# Altium project Ezlo_Voice_AssistantHUB.PrjPcb (part 3 of 10)

## Sheet Power_Sheet_1.SchDoc
size A4; DocumentNumber: 3; SheetNumber: 3; SheetTotal: 27
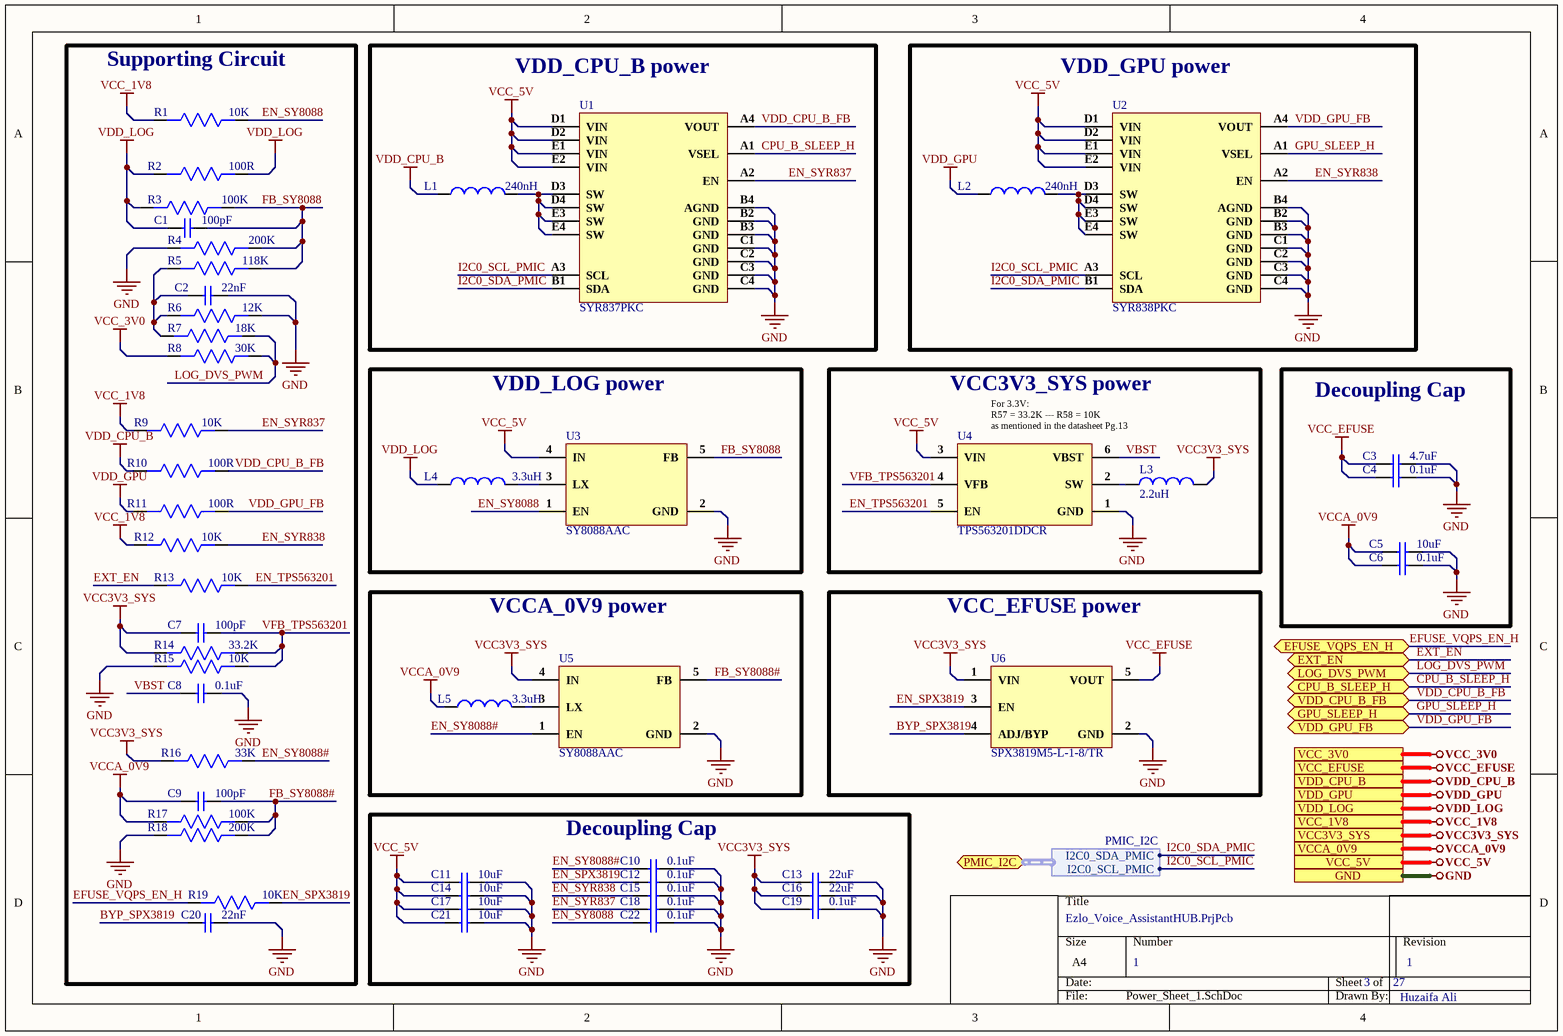
[diagram p5: Power_Sheet_1.SchDoc]

### Parts
C1  100pF  [Cap0603]
C2  22nF  [Cap0603]
C3  4.7uF  [Cap0603]
C4  0.1uF  [Cap0402]
C5  10uF  [Cap0603]
C6  0.1uF  [Cap0402]
C7  100pF  [Cap0603]
C8  0.1uF  [Cap 0402]
C9  100pF  [Cap0603]
C10  0.1uF  [Cap0402]
C11  10uF  [Cap0603]
C12  0.1uF  [Cap0402]
C13  22uF  [Cap0805]
C14  10uF  [Cap0603]
C15  0.1uF  [Cap0402]
C16  22uF  [Cap0805]
C17  10uF  [Cap0603]
C18  0.1uF  [Cap0402]
C19  0.1uF  [Cap0402]
C20  22nF  [Cap0603]
C21  10uF  [Cap0603]
C22  0.1uF  [Cap0402]
L1  240nH  [FNR5040SR24NT]
L2  240nH  [FNR5040SR24NT]
L3  2.2uH  [YSPI0520-2R2M]
L4  3.3uH  [MWPY4020-3R3M-T]
L5  3.3uH  [MWPY4020-3R3M-T]
R1  10K  [Res0603]
R2  100R  [Res0603]
R3  100K  [Res0603]
R4  200K  [Res0603]
R5  118K  [Res0603]
R6  12K  [Res0603]
R7  18K  [Res0603]
R8  30K  [Res0603]
R9  10K  [Res0603]
R10  100R  [Res0603]
R11  100R  [Res0603]
R12  10K  [Res0603]
R13  10K  [Res0603]
R14  33.2K  [Res0603]
R15  10K  [Res0603]
R16  33K  [Res0603]
R17  100K  [Res0603]
R18  200K  [Res0603]
R19  10K  [Res0603]
U1  SYR837PKC  [SYR837PKC]
U2  SYR838PKC  [SYR838PKC]
U3  SY8088AAC  [SOT-23-5]
U4  TPS563201DDCR  [TPS563201DDCR]
U5  SY8088AAC  [SOT-23-5]
U6  SPX3819M5-L-1-8/TR  [SOT-23-5]

### Blocks framed on the sheet
Supporting Circuit: C1 C2 C7-C9 C20 R1-R19
VDD_CPU_B power: L1 U1
VDD_GPU power: L2 U2
VDD_LOG power: L4 U3
VCC3V3_SYS power: L3 U4
Decoupling Cap: C3-C6
VCCA_0V9 power: L5 U5
VCC_EFUSE power: U6
Decoupling Cap: C10-C19 C21 C22

### Ports
CPU_B_SLEEP_H (bidir), EFUSE_VQPS_EN_H (bidir), EXT_EN (bidir), GND, GPU_SLEEP_H (bidir), LOG_DVS_PWM (bidir), PMIC_I2C (bidir, harness PMIC_I2C), VCC3V3_SYS, VCC_1V8, VCC_3V0, VCC_5V, VCC_EFUSE, VCCA_0V9, VDD_CPU_B, VDD_CPU_B_FB (bidir), VDD_GPU, VDD_GPU_FB (bidir), VDD_LOG

### Harnesses
PMIC_I2C: I2C0_SDA_PMIC, I2C0_SCL_PMIC

### Nets
GND: C2.2 C3.2 C4.2 C5.2 C6.2 C8.2 C10.2 C11.2 C12.2 C13.2 C14.2 C15.2 C16.2 C17.2 C18.2 C19.2 C20.2 C21.2 C22.2 R4.2 R6.1 R15.2 R18.2 U1.B2(GND) U1.B3(GND) U1.B4(AGND) U1.C1(GND) U1.C2(GND) U1.C3(GND) U1.C4(GND) U2.B2(GND) U2.B3(GND) U2.B4(AGND) U2.C1(GND) U2.C2(GND) U2.C3(GND) U2.C4(GND) U3.2(GND) U4.1(GND) U5.2(GND) U6.2(GND) ; port GND
VCC3V3_SYS: C7.1 C13.1 C16.1 C19.1 L3.2 R14.2 R16.2 U5.4(IN) U6.1(VIN) ; port VCC3V3_SYS
VCC_1V8: R1.2 R9.2 R12.2 ; port VCC_1V8
VCC_3V0: R8.2 ; port VCC_3V0
VCC_5V: C11.1 C14.1 C17.1 C21.1 U1.D1(VIN) U1.D2(VIN) U1.E1(VIN) U1.E2(VIN) U2.D1(VIN) U2.D2(VIN) U2.E1(VIN) U2.E2(VIN) U3.4(IN) U4.3(VIN) ; port VCC_5V
VCC_EFUSE: C3.1 C4.1 U6.5(VOUT) ; port VCC_EFUSE
VCCA_0V9: C5.1 C6.1 C9.1 L5.1 R17.2 ; port VCCA_0V9
VDD_CPU_B: L1.1 R10.2 ; port VDD_CPU_B
VDD_GPU: L2.1 R11.2 ; port VDD_GPU
VDD_LOG: C1.1 L4.1 R2.1 R2.2 R3.2 ; port VDD_LOG
BYP_SPX3819: C20.1 U6.4(ADJ/BYP)
CPU_B_SLEEP_H: U1.A1(VSEL) ; port CPU_B_SLEEP_H
EFUSE_VQPS_EN_H: R19.2 ; port EFUSE_VQPS_EN_H
EN_SPX3819: C12.1 R19.1 U6.3(EN)
EN_SY8088: C22.1 R1.1 U3.1(EN)
EN_SY8088#: C10.1 R16.1 U5.1(EN)
EN_SYR837: C18.1 R9.1 U1.A2(EN)
EN_SYR838: C15.1 R12.1 U2.A2(EN)
EN_TPS563201: R13.1 U4.5(EN)
EXT_EN: R13.2 ; port EXT_EN
FB_SY8088: C1.2 R3.1 R4.1 R5.1 U3.5(FB)
FB_SY8088#: C9.2 R17.1 R18.1 U5.5(FB)
GPU_SLEEP_H: U2.A1(VSEL) ; port GPU_SLEEP_H
I2C0_SCL_PMIC: U1.A3(SCL) U2.A3(SCL) ; port PMIC_I2C.I2C0_SCL_PMIC
I2C0_SDA_PMIC: U1.B1(SDA) U2.B1(SDA) ; port PMIC_I2C.I2C0_SDA_PMIC
LOG_DVS_PWM: R7.1 R8.1 ; port LOG_DVS_PWM
VBST: C8.1 U4.6(VBST)
VDD_CPU_B_FB: R10.1 U1.A4(VOUT) ; port VDD_CPU_B_FB
VDD_GPU_FB: R11.1 U2.A4(VOUT) ; port VDD_GPU_FB
VFB_TPS563201: C7.2 R14.1 R15.1 U4.4(VFB)
NetC2_1: C2.1 R5.2 R6.2 R7.2
NetL1_2: L1.2 U1.D3(SW) U1.D4(SW) U1.E3(SW) U1.E4(SW)
NetL2_2: L2.2 U2.D3(SW) U2.D4(SW) U2.E3(SW) U2.E4(SW)
NetL3_1: L3.1 U4.2(SW)
NetL4_2: L4.2 U3.3(LX)
NetL5_2: L5.2 U5.3(LX)

### Notes on the sheet
- (near U4) For 3.3V:
  R57 = 33.2K --- R58 = 10K
  as mentioned in the datasheet Pg.13
- 1
- Huzaifa Ali

### Library data of the parts
C1 C7 C9 = CC0603JRNPO9BN101: CAP CER 100PF 50V C0G/NPO 0603; Manufacturer: Yageo; Tolerance: 5%; Dielectric: C0G; Temperature Coefficient: 30ppm/°C; Insulation Resistance: 100GR; Supplier 1: Arrow Electronics; Manufacturer Part Number: CC0603JRNPO9BN101; RoHS: Yes; Category: Ceramic Capacitors; Stock 1: 10744; Pricing 1: 1=0.06030, 10=0.04400, 25=0.02170, 100=0.01580, 250=0.01330, 500=0.01300, 1000=0.01150, 3000=0.01010, 6000=0.00680 (USD); Mount: Surface Mount; Case/Package: 0603; Number of Pins: 2; Case Code (Imperial): 0603; Case Code (Metric): 1608; Min Operating Temperature: -55°C; Max Operating Temperature: 125°C; Capacitance: 100pF; Voltage: 50V; Voltage Rating: 50V; Voltage Rating (DC): 50V; Packaging: Tape and Reel; Package Quantity: 1; Termination: SMD/SMT; Resistor Type: Ceramic; Series: CC; Length: 1.6mm; Width: 0.8mm; Height: 0.8mm; Thickness: 0.035inch; Depth: 0.8mm; Radiation Hardening: No; RoHS Compliant: Yes; REACH SVHC: Unknown; Lead Free: Lead Free; ComponentLink1URL: https://datasheet.ciiva.com/11786/0900766b8079c870-11786060.pdf?src-supplier=RSComponents; ComponentLink1Description: https://datasheet.ciiva.com/11786/0900766b8079c870-11786060.pdf?src-supplier=RSComponents; ComponentLink2URL: https://datasheet.ciiva.com/7978/1443161-7978127.pdf?src-supplier=Element14; ComponentLink2Description: https://datasheet.ciiva.com/7978/1443161-7978127.pdf?src-supplier=Element14; ComponentLink3URL: https://datasheet.ciiva.com/28450/1443161-28450457.pdf?src-supplier=Element14; ComponentLink3Description: https://datasheet.ciiva.com/28450/1443161-28450457.pdf?src-supplier=Element14; ComponentLink4URL: https://datasheet.ciiva.com/46430/1835847-46430151.pdf?src-supplier=Element14; ComponentLink4Description: https://datasheet.ciiva.com/46430/1835847-46430151.pdf?src-supplier=Element14; ComponentLink5URL: https://datasheet.ciiva.com/144/mlccorderingcode-144629.pdf?src-supplier=Digi-Key; ComponentLink5Description: https://datasheet.ciiva.com/144/mlccorderingcode-144629.pdf?src-supplier=Digi-Key; ComponentLink6URL: https://datasheet.ciiva.com/144/mlccorderingcode-144628.pdf?src-supplier=Digi-Key; ComponentLink6Description: https://datasheet.ciiva.com/144/mlccorderingcode-144628.pdf?src-supplier=Digi-Key; ComponentLink7URL: https://datasheet.ciiva.com/144/mlccorderingcode-144630.pdf?src-supplier=Digi-Key; ComponentLink7Description: https://datasheet.ciiva.com/144/mlccorderingcode-144630.pdf?src-supplier=Digi-Key; ComponentLink8URL: https://datasheet.ciiva.com/11464/upy-gp-np0-16v-to-50v-8-11464725.pdf?src-supplier=Avnet; ComponentLink8Description: https://datasheet.ciiva.com/11464/upy-gp-np0-16v-to-50v-8-11464725.pdf?src-supplier=Avnet; ComponentLink9URL: https://datasheet.ciiva.com/26829/getdatasheetpartid-403525-26829372.pdf?src-supplier=Verical; ComponentLink9Description: https://datasheet.ciiva.com/26829/getdatasheetpartid-403525-26829372.pdf?src-supplier=Verical; Supplier Part Number 1: CC0603JRNPO9BN101
C2 C20 = CC0603KRX7R9BB223: CAP CER 0.022UF 50V X7R 0603; Manufacturer: Yageo; Dielectric Material: Ceramic; Tolerance: 10%; Insulation Resistance: 100GR; Supplier 1: Digi-Key; Manufacturer Part Number: CC0603KRX7R9BB223; RoHS: Yes; Category: Ceramic Capacitors; Stock 1: 119735; Pricing 1: 1=0.10000, 10=0.05500, 50=0.03020, 100=0.02460, 500=0.01760, 1000=0.01383 (USD); Mount: Surface Mount; Case/Package: 0603; Number of Pins: 2; Case Code (Metric): 1608; Case Code (Imperial): 0603; Min Operating Temperature: -55°C; Max Operating Temperature: 125°C; Capacitance: 22nF; Dielectric: X7R; Voltage: 50V; Package Quantity: 1; Voltage Rating: 50V; Packaging: Tape and Reel; Voltage Rating (DC): 50V; Termination: SMD/SMT; Resistor Type: Ceramic; Series: CC; Length: 1.6mm; Width: 0.031inch; Height: 0.8mm; Depth: 0.8mm; Thickness: 0.035inch; Radiation Hardening: No; RoHS Compliant: Yes; REACH SVHC: No SVHC; Lead Free: Lead Free; Halogen Free: Halogen Free; ComponentLink1URL: https://datasheet.ciiva.com/8033/70765-8033869.pdf?src-supplier=Element14; ComponentLink1Description: https://datasheet.ciiva.com/8033/70765-8033869.pdf?src-supplier=Element14; ComponentLink2URL: https://datasheet.ciiva.com/28450/1489800-28450639.pdf?src-supplier=Element14; ComponentLink2Description: https://datasheet.ciiva.com/28450/1489800-28450639.pdf?src-supplier=Element14; ComponentLink3URL: https://datasheet.ciiva.com/8033/1489800-8033867.pdf?src-supplier=Element14; ComponentLink3Description: https://datasheet.ciiva.com/8033/1489800-8033867.pdf?src-supplier=Element14; ComponentLink4URL: https://datasheet.ciiva.com/8033/1489800-8033865.pdf?src-supplier=Element14; ComponentLink4Description: https://datasheet.ciiva.com/8033/1489800-8033865.pdf?src-supplier=Element14; ComponentLink5URL: https://datasheet.ciiva.com/156/mlccorderingcode-156178.pdf?src-supplier=Digi-Key; ComponentLink5Description: https://datasheet.ciiva.com/156/mlccorderingcode-156178.pdf?src-supplier=Digi-Key; ComponentLink6URL: https://datasheet.ciiva.com/156/mlccorderingcode-156177.pdf?src-supplier=Digi-Key; ComponentLink6Description: https://datasheet.ciiva.com/156/mlccorderingcode-156177.pdf?src-supplier=Digi-Key; ComponentLink7URL: https://datasheet.ciiva.com/156/mlccorderingcode-156179.pdf?src-supplier=Digi-Key; ComponentLink7Description: https://datasheet.ciiva.com/156/mlccorderingcode-156179.pdf?src-supplier=Digi-Key; ComponentLink8URL: https://datasheet.ciiva.com/11464/upy-gphc-x7r-6-3v-to-50v-8-11464741.pdf?src-supplier=Avnet; ComponentLink8Description: https://datasheet.ciiva.com/11464/upy-gphc-x7r-6-3v-to-50v-8-11464741.pdf?src-supplier=Avnet; Supplier Part Number 1: 311-1370-1-ND
C3 = CL10A475KA8NQNC: CAP CER 4.7UF 25V X5R 0603; Manufacturer: Samsung; Tolerance: 10%; Supplier 1: Arrow Electronics; Manufacturer Part Number: CL10A475KA8NQNC; RoHS: Yes; Category: Ceramic Capacitors; Stock 1: 260000; Pricing 1: 4000=0.08490, 8000=0.05240, 16000=0.05180, 24000=0.05130, 40000=0.05070 (USD); Mount: Surface Mount; Case/Package: 0603; Case Code (Metric): 1608; Case Code (Imperial): 0603; Contact Plating: Tin; Min Operating Temperature: -55°C; Max Operating Temperature: 85°C; Package Quantity: 1; Packaging: Tape and Reel; Capacitance: 4.7uF; Voltage Rating: 25V; Dielectric: X5R; Series: CL; Termination: Wraparound; Construction: Flat; Length: 1.6mm; Width: 0.031inch; Thickness: 0.035inch; Depth: 0.8mm; Lead Free: Lead Free; RoHS Compliant: Yes; ComponentLink1URL: https://datasheet.ciiva.com/25787/cl10a475ka8nqnc-25787017.pdf?src-supplier=Digi-Key; ComponentLink1Description: https://datasheet.ciiva.com/25787/cl10a475ka8nqnc-25787017.pdf?src-supplier=Digi-Key; Supplier Part Number 1: CL10A475KA8NQNC
C4 C6 C10 C12 C15 C18 C19 C22 = CC0402KRX5R6BB104: CAP CER 0.1UF 10V X5R 0402; Manufacturer: Yageo; Capacitance: 100nF; Tolerance: 10%; Dissipation Factor: 5%; Insulation Resistance: 10GR; Supplier 1: Digi-Key; Manufacturer Part Number: CC0402KRX5R6BB104; RoHS: Yes; Category: Ceramic Capacitors; Stock 1: 6385580; Pricing 1: 1=0.10000, 10=0.02700, 50=0.01500, 100=0.01220, 500=0.00874, 1000=0.00687, 2500=0.00625, 5000=0.00575 (USD); Mount: Surface Mount; Case/Package: 0402; Number of Pins: 2; Case Code (Imperial): 0402; Case Code (Metric): 1005; Min Operating Temperature: -55°C; Max Operating Temperature: 85°C; Dielectric: X5R; Packaging: Tape and Reel; Voltage Rating: 10V; Package Quantity: 1; Termination: SMD/SMT; Voltage Rating (DC): 10V; Series: CC; Length: 1mm; Width: 0.02inch; Height: 0.5mm; Depth: 0.5mm; Thickness: 0.022inch; Radiation Hardening: No; RoHS Compliant: Yes; REACH SVHC: No SVHC; Lead Free: Lead Free; Halogen Free: Halogen Free; ComponentLink1URL: https://datasheet.ciiva.com/144/mlccorderingcode-144029.pdf?src-supplier=Digi-Key; ComponentLink1Description: https://datasheet.ciiva.com/144/mlccorderingcode-144029.pdf?src-supplier=Digi-Key; ComponentLink2URL: https://datasheet.ciiva.com/144/mlccorderingcode-144028.pdf?src-supplier=Digi-Key; ComponentLink2Description: https://datasheet.ciiva.com/144/mlccorderingcode-144028.pdf?src-supplier=Digi-Key; ComponentLink3URL: https://datasheet.ciiva.com/144/mlccorderingcode-144030.pdf?src-supplier=Digi-Key; ComponentLink3Description: https://datasheet.ciiva.com/144/mlccorderingcode-144030.pdf?src-supplier=Digi-Key; ComponentLink4URL: https://datasheet.ciiva.com/7978/1359354-7978091.pdf?src-supplier=Element14; ComponentLink4Description: https://datasheet.ciiva.com/7978/1359354-7978091.pdf?src-supplier=Element14; ComponentLink5URL: https://datasheet.ciiva.com/11587/upy-gphc-x5r-4v-to-50v-12-11587302.pdf?src-supplier=Avnet; ComponentLink5Description: https://datasheet.ciiva.com/11587/upy-gphc-x5r-4v-to-50v-12-11587302.pdf?src-supplier=Avnet; Supplier Part Number 1: 311-1336-1-ND
C5 C11 C14 C17 C21 = C1608X5R1E106M080AC: CAP CER 10UF 25V X5R 0603; Manufacturer: TDK; Dielectric Material: Ceramic; Tolerance: 20%; Supplier 1: Digi-Key; Manufacturer Part Number: C1608X5R1E106M080AC; Stock 1: 61681; Pricing 1: 1=0.96, 10=0.704, 100=0.483, 500=0.38238, 1000=0.322 (USD); Mount: Surface Mount; Case/Package: 0603; Weight: 7.1E-05oz; Case Code (Imperial): 0603; Case Code (Metric): 1608; Min Operating Temperature: -55°C; Max Operating Temperature: 85°C; Capacitance: 10uF; Packaging: Tape and Reel; Voltage Rating: 25V; Voltage Rating (DC): 25V; Termination: SMD/SMT; Package Quantity: 1; Dielectric: X5R; Composition: Ceramic; Length: 1.6mm; Height: 0.8mm; Width: 0.8mm; Thickness: 0.039inch; Depth: 0.8mm; Lead Free: Lead Free; REACH SVHC: No SVHC; Supplier Part Number 1: 445-9015-1-ND
C8 = GRM155R71H104ME14D: CAP CER 0.1UF 50V X7R 0402; Manufacturer: Murata; Tolerance: 20%; Capacitance: 100nF; Supplier 1: Digi-Key; Manufacturer Part Number: GRM155R71H104ME14D; Stock 1: 439844; Pricing 1: 1=0.1, 10=0.038, 100=0.0168, 500=0.01198, 1000=0.00941, 2500=0.00855, 5000=0.00787 (USD); Mount: Surface Mount; Case/Package: 0402; Min Operating Temperature: -55°C; Max Operating Temperature: 125°C; Packaging: Cut Tape; Voltage Rating: 50V; Length: 0.039inch; Width: 0.02inch; Thickness: 0.022inch; ComponentLink1URL: http://search.murata.co.jp/Ceramy/image/img/A01X/G101/ENG/GRM155R71H104ME14-01.pdf?src-supplier=Digi-Key; ComponentLink1Description: http://search.murata.co.jp/Ceramy/image/img/A01X/G101/ENG/GRM155R71H104ME14-01.pdf?src-supplier=Digi-Key; ComponentLink2URL: http://psearch.en.murata.com/capacitor/product/GRM155R71H104ME14%23.pdf?src-supplier=Avnet; ComponentLink2Description: http://psearch.en.murata.com/capacitor/product/GRM155R71H104ME14%23.pdf?src-supplier=Avnet; ComponentLink3URL: http://components.arrow.com/part/dataview/0323_07177683?src-supplier=Arrow+Europe; ComponentLink3Description: http://components.arrow.com/part/dataview/0323_07177683?src-supplier=Arrow+Europe; ComponentLink4URL: http://www.mouser.com/ds/2/281/c02e-2905.pdf?src-supplier=Mouser; ComponentLink4Description: http://www.mouser.com/ds/2/281/c02e-2905.pdf?src-supplier=Mouser; Supplier Part Number 1: 490-10701-1-ND
C13 C16 = CL21A226MAYNNNE: 0803 22uF 25V X5R 20% multilayer ceramic capacitor; Manufacturer: Samsung; Supplier 1: Digi-Key; Manufacturer Part Number: CL21A226MAYNNNE; RoHS: Yes; Category: Ceramic Capacitors; Stock 1: 442950; Pricing 1: 2000=0.07687, 4000=0.07110, 10000=0.06726, 14000=0.06380, 50000=0.05765 (USD); RoHS Compliant: Yes; Supplier Part Number 1: 1276-CL21A226MAYNNNETR-ND
L1 L2 = FNR5040SR24NT: 6.4A 240nH ±30% 8mΩ SMD Power Inductors ROHS; Manufacturer: cjiang; Manufacturer Part Number: FNR5040SR24NT; Footprint: Custom; ComponentLink1Description: LCSC; ComponentLink1URL: https://www.lcsc.com/product-detail/span-style-background-color-ff0-Power-span-span-style-background-color-ff0-Inductors-span_cjiang-Changjiang-Microelectronics-Tech-FNR5040SR24NT_C167951.html
L3 = YSPI0520-2R2M: 4A 2.2uH ±20% 32mΩ SMD,5.4x5.2x2mm Power Inductors ROHS; Manufacturer: YJYCOIN; Manufacturer Part Number: YSPI0520-2R2M; Footprint: Custom; ComponentLink1Description: LCSC; ComponentLink1URL: https://www.lcsc.com/product-detail/Power-Inductors_YJYCOIN-YSPI0520-2R2M_C718375.html
L4 L5 = MWPY4020-3R3M-T: 1.4A 3.3uH ±20% 0.07Ω 3.2A SMD,4x4x2mm Power Inductors ROHS; Manufacturer: Me-TECH; Manufacturer Part Number: MWPY4020-3R3M-T; Footprint: Footprint; ComponentLink1Description: LCSC; ComponentLink1URL: https://lcsc.com/product-detail/Power-Inductors_Me-TECH-MWPY4020-3R3M-T_C2934994.html
R1 R9 R12 R13 R15 R19 = AC0603JR-0710KL: RES SMD 10K OHM 5% 1/10W 0603; Manufacturer: Yageo; Voltage Rating: 50V; Resistance: 10kR; Power Rating: 100mW; Temperature Coefficient: 100ppm/°C; Supplier 1: Future Electronics; Manufacturer Part Number: AC0603JR-0710KL; RoHS: Yes; Category: Chip SMD Resistors; Stock 1: 1533000; Pricing 1: 5000=0.00540 (USD); Case/Package: 0603; Case Code (Imperial): 0603; Case Code (Metric): 1608; Size Code: 0603; Min Operating Temperature: -55°C; Max Operating Temperature: 155°C; Packaging: Tape and Reel; Tolerance: 5%; Package Quantity: 1; Resistor Type: Thick Film; Termination: SMD/SMT; Number of Terminations: 2; Max Power Dissipation: 100mW; Features: Moisture Resistant,Automotive AEC-Q200,Anti-Sulfur; Series: AC; Construction: Rectangular; Length: 0.063inch; Width: 0.031inch; Height: 0.022inch; Depth: 0.8mm; Military Standard: Not; Lead Free: Lead Free; RoHS Compliant: Yes; ComponentLink1URL: https://datasheet.ciiva.com/5562/pyu-ac-51-rohs-l-2-5562553.pdf?src-supplier=Mouser; ComponentLink1Description: https://datasheet.ciiva.com/5562/pyu-ac-51-rohs-l-2-5562553.pdf?src-supplier=Mouser; Supplier Part Number 1: 1029044
R2 R10 R11 = FRC0603J101 TS: 100mW Thick Film Resistors 50V ±5% ±100ppm/℃ -55℃~+155℃ 100Ω 0603 Chip Resistor - Surface Mount ROHS; Manufacturer: FOJAN; Manufacturer Part Number: FRC0603J101 TS; Value: 100R; Footprint: 0603
R3 R17 = RT0603BRD07100KL: RES SMD 100K OHM 0.1% 1/10W 0603; Manufacturer: Yageo; Resistance: 100kR; Temperature Coefficient: 25ppm/°C; Voltage Rating (DC): 75V; Power Rating: 100mW; Supplier 1: Digi-Key; Manufacturer Part Number: RT0603BRD07100KL; Stock 1: 53395; Pricing 1: 1=0.39, 10=0.332, 100=0.1298, 1000=0.05435, 2500=0.04982 (USD); Mount: Surface Mount; Case/Package: 0603; Case Code (Imperial): 0603; Case Code (Metric): 1608; Min Operating Temperature: -55°C; Max Operating Temperature: 125°C; Tolerance: 0.1%; Composition: Thin Film; Packaging: Tape and Reel; Voltage Rating: 75V; Package Quantity: 5000; Termination: SMD/SMT; Number of Terminations: 2; Military Standard: Not; Max Power Dissipation: 100mW; Working Voltage: 75V; Features: Moisture Resistant; Length: 1.6mm; Height: 0.022inch; Width: 0.031inch; Depth: 0.8mm; Lead Free: Lead Free; ComponentLink1URL: http://documents.rs-components.com/techlib://itc_doclist_GB.htm?stockno=6174810&src-supplier=RSComponents; ComponentLink1Description: http://documents.rs-components.com/techlib://itc_doclist_GB.htm?stockno=6174810&src-supplier=RSComponents; Supplier Part Number 1: YAG1235CT-ND
R4 R18 = RT0603DRD07200KL: RES SMD 200K OHM 0.5% 1/10W 0603; Manufacturer: Yageo; Voltage Rating: 75V; Resistance: 200kR; Power Rating: 100mW; Temperature Coefficient: 25ppm/°C; Voltage Rating (DC): 50V; Supplier 1: Digi-Key; Manufacturer Part Number: RT0603DRD07200KL; Stock 1: 88258; Pricing 1: 1=0.21, 10=0.174, 100=0.0682, 1000=0.02855, 2500=0.02617 (USD); Case/Package: 0603; Case Code (Metric): 1608; Case Code (Imperial): 0603; Min Operating Temperature: -55°C; Max Operating Temperature: 125°C; Tolerance: 0.5%; Packaging: Tape and Reel; Termination: SMD/SMT; Lead Free: Lead Free; Supplier Part Number 1: 311-200KDCT-ND
R5 = ARG03BTC1183: 118kΩ 0603 Chip Resistor - Surface Mount ROHS; Manufacturer: Viking; ComponentLink1Description: LCSC; ComponentLink1URL: https://lcsc.com/product-detail/Chip-span-style-background-color-ff0-Resistor-span-Surface-Mount_Viking-Tech-ARG03BTC1183_C1509622.html; Manufacturer Part Number: ARG03BTC1183; Footprint: 0603
R6 = RTT031202BTP: 12kΩ 0603 Chip Resistor - Surface Mount ROHS; Manufacturer: RALEC; Manufacturer Part Number: RTT031202BTP; Footprint: 0603; ComponentLink1Description: LCSC; ComponentLink1URL: https://lcsc.com/product-detail/Chip-span-style-background-color-ff0-Resistor-span-Surface-Mount_RALEC-RTT031202BTP_C2981490.html
R7 = RC0603FR-0718KL: RES 18K OHM 1% 1/10W 0603; Manufacturer: Yageo; Power Rating: 100mW; Voltage Rating: 75V; Voltage Rating (DC): 50V; Temperature Coefficient: 100ppm/°C; Resistance: 18kR; Supplier 1: Digi-Key; Supplier Part Number 1: 311-18.0KHRCT-ND; Manufacturer Part Number: RC0603FR-0718KL; RoHS: Yes; Category: Chip SMD Resistors; Stock 1: 1173301; Pricing 1: 1=0.10000, 10=0.02300, 100=0.00930, 1000=0.00417, 2500=0.00362 (USD); Case/Package: 0603; Number of Pins: 2; Case Code (Imperial): 0603; Case Code (Metric): 1608; Weight: 7.1E-05oz; Size Code: 0603; Min Operating Temperature: -55°C; Max Operating Temperature: 155°C; Resistor Type: Thick Film; Tolerance: 1%; Packaging: Tape and Reel; Termination: SMD/SMT; Features: Moisture Resistant; Series: RC; Max Power Dissipation: 100mW; Number of Terminations: 2; Resistance Tolerance: 1%; Technology: THICK FILM; Construction: Rectangular; Length: 1.6mm; Width: 0.8mm; Height: 0.45mm; Depth: 0.8mm; RoHS Compliant: Yes; REACH SVHC: Unknown; Military Standard: Not; Lead Free: Lead Free; ComponentLink1URL: https://datasheet.ciiva.com/11819/0900766b80f96399-11819270.pdf?src-supplier=RSComponents; ComponentLink1Description: https://datasheet.ciiva.com/11819/0900766b80f96399-11819270.pdf?src-supplier=RSComponents; ComponentLink2URL: https://datasheet.ciiva.com/7746/443971-7746268.pdf?src-supplier=Element14; ComponentLink2Description: https://datasheet.ciiva.com/7746/443971-7746268.pdf?src-supplier=Element14; ComponentLink3URL: https://datasheet.ciiva.com/7746/443971-7746269.pdf?src-supplier=Element14; ComponentLink3Description: https://datasheet.ciiva.com/7746/443971-7746269.pdf?src-supplier=Element14; ComponentLink4URL: https://datasheet.ciiva.com/15189/getdatasheetpartid-325162-15189626.pdf?src-supplier=Verical; ComponentLink4Description: https://datasheet.ciiva.com/15189/getdatasheetpartid-325162-15189626.pdf?src-supplier=Verical; Supplier 2: Digi-Key; Stock 2: 1087850; Pricing 2: 1=0.10000, 10=0.02300, 100=0.00930, 1000=0.00417, 2500=0.00362 (USD); Package Quantity: 5000; ComponentLink5URL: https://datasheet.ciiva.com/46395/443971-46395003.pdf?src-supplier=Element14; ComponentLink5Description: https://datasheet.ciiva.com/46395/443971-46395003.pdf?src-supplier=Element14; ComponentLink6URL: https://datasheet.ciiva.com/12558/rc0603-272842-12558744.pdf?src-supplier=Mouser; ComponentLink6Description: https://datasheet.ciiva.com/12558/rc0603-272842-12558744.pdf?src-supplier=Mouser; Supplier Part Number 2: 311-30.0KHRCT-ND
R8 = RC0603FR-0730KL: RES 30K OHM 1% 1/10W 0603; Supplier 1: Digi-Key; Supplier Part Number 1: 311-30.0KHRCT-ND
R14 = RC0603FR-0733K2L: RES 33.2K OHM 1% 1/10W 0603; Manufacturer: Yageo; Resistance: 33.2kR; Power Rating: 100mW; Voltage Rating: 50V; Temperature Coefficient: 100ppm/°C; Supplier 1: Digi-Key; Manufacturer Part Number: RC0603FR-0733K2L; RoHS: Yes; Category: Chip SMD Resistors; Stock 1: 1293262; Pricing 1: 1=0.10000, 10=0.02300, 100=0.00930, 1000=0.00417, 2500=0.00362 (USD); Mount: Surface Mount; Case/Package: 0603; Case Code (Imperial): 0603; Case Code (Metric): 1608; Size Code: 0603; Min Operating Temperature: -55°C; Max Operating Temperature: 155°C; Tolerance: 1%; Packaging: Tape and Reel; Termination: SMD/SMT; Resistor Type: Thick Film; Voltage Rating (DC): 50V; Features: Moisture Resistant; Series: RC; Max Power Dissipation: 100mW; Number of Terminations: 2; Construction: Rectangular; Technology: THICK FILM; Length: 1.6mm; Height: 0.45mm; Depth: 0.8mm; Military Standard: Not; Lead Free: Lead Free; RoHS Compliant: Yes; ComponentLink1URL: https://datasheet.ciiva.com/11808/0900766b80f96399-11808316.pdf?src-supplier=RSComponents; ComponentLink1Description: https://datasheet.ciiva.com/11808/0900766b80f96399-11808316.pdf?src-supplier=RSComponents; Supplier Part Number 1: 311-33.2KHRCT-ND
R16 = RT0603BRD0733KL: RES SMD 33K OHM 0.1% 1/10W 0603; Manufacturer: Yageo; Resistance: 33kR; Power Rating: 100mW; Voltage Rating: 75V; Temperature Coefficient: 25ppm/°C; Voltage Rating (DC): 50V; Supplier 1: Arrow Electronics; Manufacturer Part Number: RT0603BRD0733KL; RoHS: Yes; Category: Chip SMD Resistors; Stock 1: 2; Pricing 1: 1=0.30860 (USD); Case/Package: 0603; Case Code (Metric): 1608; Case Code (Imperial): 0603; Weight: 7.1E-05oz; Contact Plating: Tin,Matte; Size Code: 0603; Min Operating Temperature: -55°C; Max Operating Temperature: 125°C; Package Quantity: 5000; Packaging: Tape and Reel; Resistor Type: Thin Film; Number of Terminations: 2; Termination: SMD/SMT; Max Power Dissipation: 100mW; Features: Moisture Resistant; Series: RT; Construction: Rectangular; Length: 1.6mm; Width: 0.031inch; Height: 0.022inch; Depth: 0.8mm; Radiation Hardening: No; Military Standard: Not; Lead Free: Lead Free; RoHS Compliant: Yes; ComponentLink1URL: https://datasheet.ciiva.com/2585/pyu-rt-1-to-0-05-rohs-l-4-2585891.pdf?src-supplier=Digi-Key; ComponentLink1Description: https://datasheet.ciiva.com/2585/pyu-rt-1-to-0-05-rohs-l-4-2585891.pdf?src-supplier=Digi-Key; ComponentLink2URL: https://datasheet.ciiva.com/12810/pyu-rt-1-to-0-05-rohs-l-4-12810117.pdf?src-supplier=Mouser; ComponentLink2Description: https://datasheet.ciiva.com/12810/pyu-rt-1-to-0-05-rohs-l-4-12810117.pdf?src-supplier=Mouser; ComponentLink3URL: https://datasheet.ciiva.com/8889/pyu-rt-1-to-0-05-rohs-l-4-8889590.pdf?src-supplier=Avnet; ComponentLink3Description: https://datasheet.ciiva.com/8889/pyu-rt-1-to-0-05-rohs-l-4-8889590.pdf?src-supplier=Avnet; Supplier Part Number 1: RT0603BRD0733KL
U1 = SYR837PKC: Step-down type CSP1.56*1.96-20 DC-DC Converters ROHS; Manufacturer: Silergy; Supplier 1: Avnet; Manufacturer Part Number: SYR837PKC; RoHS: No; RoHS Compliant: Yes; Supplier Part Number 1: SYR837PKC
U2 = SYR838PKC: Step-down type CSP1.56*1.96-20 DC-DC Converters ROHS; Manufacturer: Silergy; Supplier 1: Avnet; Manufacturer Part Number: SYR838PKC; RoHS: Yes; Supplier Part Number 1: SYR838PKC
U3 U5 = SY8088AAC: Step-down type SOT-23-5 DC-DC Converters ROHS; Manufacturer: Silergy Corp; Manufacturer Part Number: SY8088AAC; ComponentLink1Description: LCSC; ComponentLink1URL: https://www.lcsc.com/product-detail/DC-DC-Converters_Silergy-Corp-SY8088AAC_C79313.html
U4 = TPS563201DDCR: IC REG BUCK ADJ 3A TSOT23-6; Manufacturer: Texas Instruments; Number of Outputs: 1; Min Input Voltage: 4.5V; Max Input Voltage: 17V; Min Output Voltage: 768mV; Max Output Voltage: 7V; Switching Frequency: 580kHz; Synchronous Rectifier: Yes; Quiescent Current: 400uA; Output Type: Adjustable; Output Configuration: Positive; Supplier 1: Digi-Key; Manufacturer Part Number: TPS563201DDCR; Stock 1: 0; Pricing 1: 1=0.92, 10=0.812, 25=0.7628, 100=0.5781, 250=0.492, 500=0.4674, 1000=0.3567 (USD); Mount: Surface Mount; Case/Package: SOT-23-6; Number of Pins: 6; Min Operating Temperature: -40°C; Max Operating Temperature: 125°C; Packaging: Tape and Reel; Output Current: 3A; Lead Free: Lead Free; ComponentLink1URL: http://www.ti.com/lit/ds/symlink/tps563201.pdf?src-supplier=Digi-Key; ComponentLink1Description: http://www.ti.com/lit/ds/symlink/tps563201.pdf?src-supplier=Digi-Key; ComponentLink2URL: http://www.ti.com/general/docs/suppproductinfo.tsp?distId=10&amp;gotoUrl=http%3A%2F%2Fwww.ti.com%2Flit%2Fgpn%2Ftps563201&src-supplier=Digi-Key; ComponentLink2Description: http://www.ti.com/general/docs/suppproductinfo.tsp?distId=10&amp;gotoUrl=http%3A%2F%2Fwww.ti.com%2Flit%2Fgpn%2Ftps563201&src-supplier=Digi-Key; ComponentLink3URL: http://www.ti.com/lit/gpn/tps563201?src-supplier=Mouser; ComponentLink3Description: http://www.ti.com/lit/gpn/tps563201?src-supplier=Mouser; Supplier Part Number 1: 296-47238-6-ND
U6 = SPX3819M5-L-1-8/TR: LDO Voltage Regulators 500mA LOW NOISE LDO; Manufacturer: MaxLinear; Supplier 1: Mouser; Manufacturer Part Number: SPX3819M5-L-1-8/TR; RoHS: Yes; Stock 1: 19446; Pricing 1: 1=0.68000, 10=0.57700, 50=0.57700, 100=0.40000, 1000=0.26200, 10000=0.21000 (USD); RoHS Compliant: Yes; ComponentLink1URL: https://www.exar.com/content/document.ashx?id=22106&src-supplier=Digi-Key; ComponentLink1Description: https://www.exar.com/content/document.ashx?id=22106&src-supplier=Digi-Key; Supplier Part Number 1: 701-SPX3819M5-L-18TR